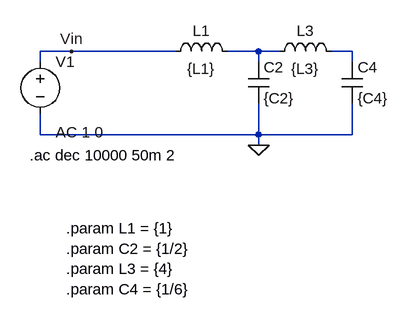
[diagram p0: schematic cauer_inf.asc]
cauer_inf.asc, the LTspice schematic file:
Version 4.1
SHEET 1 880 680
WIRE 0 144 -48 144
WIRE 160 144 0 144
WIRE 288 144 240 144
WIRE 320 144 288 144
WIRE 432 144 400 144
WIRE -48 160 -48 144
WIRE 288 160 288 144
WIRE 432 160 432 144
WIRE -48 272 -48 240
WIRE 288 272 288 224
WIRE 288 272 -48 272
WIRE 432 272 432 224
WIRE 432 272 288 272
WIRE 288 288 288 272
FLAG 0 144 Vin
FLAG 288 288 0
SYMBOL voltage -48 144 R0
WINDOW 123 24 124 Left 2
WINDOW 39 0 0 Left 0
SYMATTR Value2 AC 1 0
SYMATTR InstName V1
SYMATTR Value ""
SYMBOL ind 144 160 R270
WINDOW 0 32 56 VTop 2
WINDOW 3 5 56 VBottom 2
SYMATTR InstName L1
SYMATTR Value {L1}
SYMATTR SpiceLine Rser=1m
SYMBOL cap 272 160 R0
SYMATTR InstName C2
SYMATTR Value {C2}
SYMBOL ind 304 160 R270
WINDOW 0 32 56 VTop 2
WINDOW 3 5 56 VBottom 2
SYMATTR InstName L3
SYMATTR Value {L3}
SYMATTR SpiceLine Rser=1m
SYMBOL cap 416 160 R0
SYMATTR InstName C4
SYMATTR Value {C4}
TEXT -64 304 Left 2 !.ac dec 10000 50m 2
TEXT -8 416 Left 2 !.param L1 = {1}\n.param C2 = {1/2}\n.param L3 = {4}\n.param C4 = {1/6}

The netlist it stands for:
* cauer_inf.asc
V1 Vin 0 AC 1 0
L1 Vin N001 {L1} Rser=1m
C2 N001 0 {C2}
L3 N001 N002 {L3} Rser=1m
C4 N002 0 {C4}
.ac dec 10000 50m 2
.param L1 = {1}
.param C2 = {1/2}
.param L3 = {4}
.param C4 = {1/6}
.backanno
.end